# Altium project Master-Board-v2.0.PrjPcb (part 6 of 11)

## Sheet Display-Sheet.SchDoc
size 420 x 297 mm; SheetNumber: 5; SheetTotal: 15
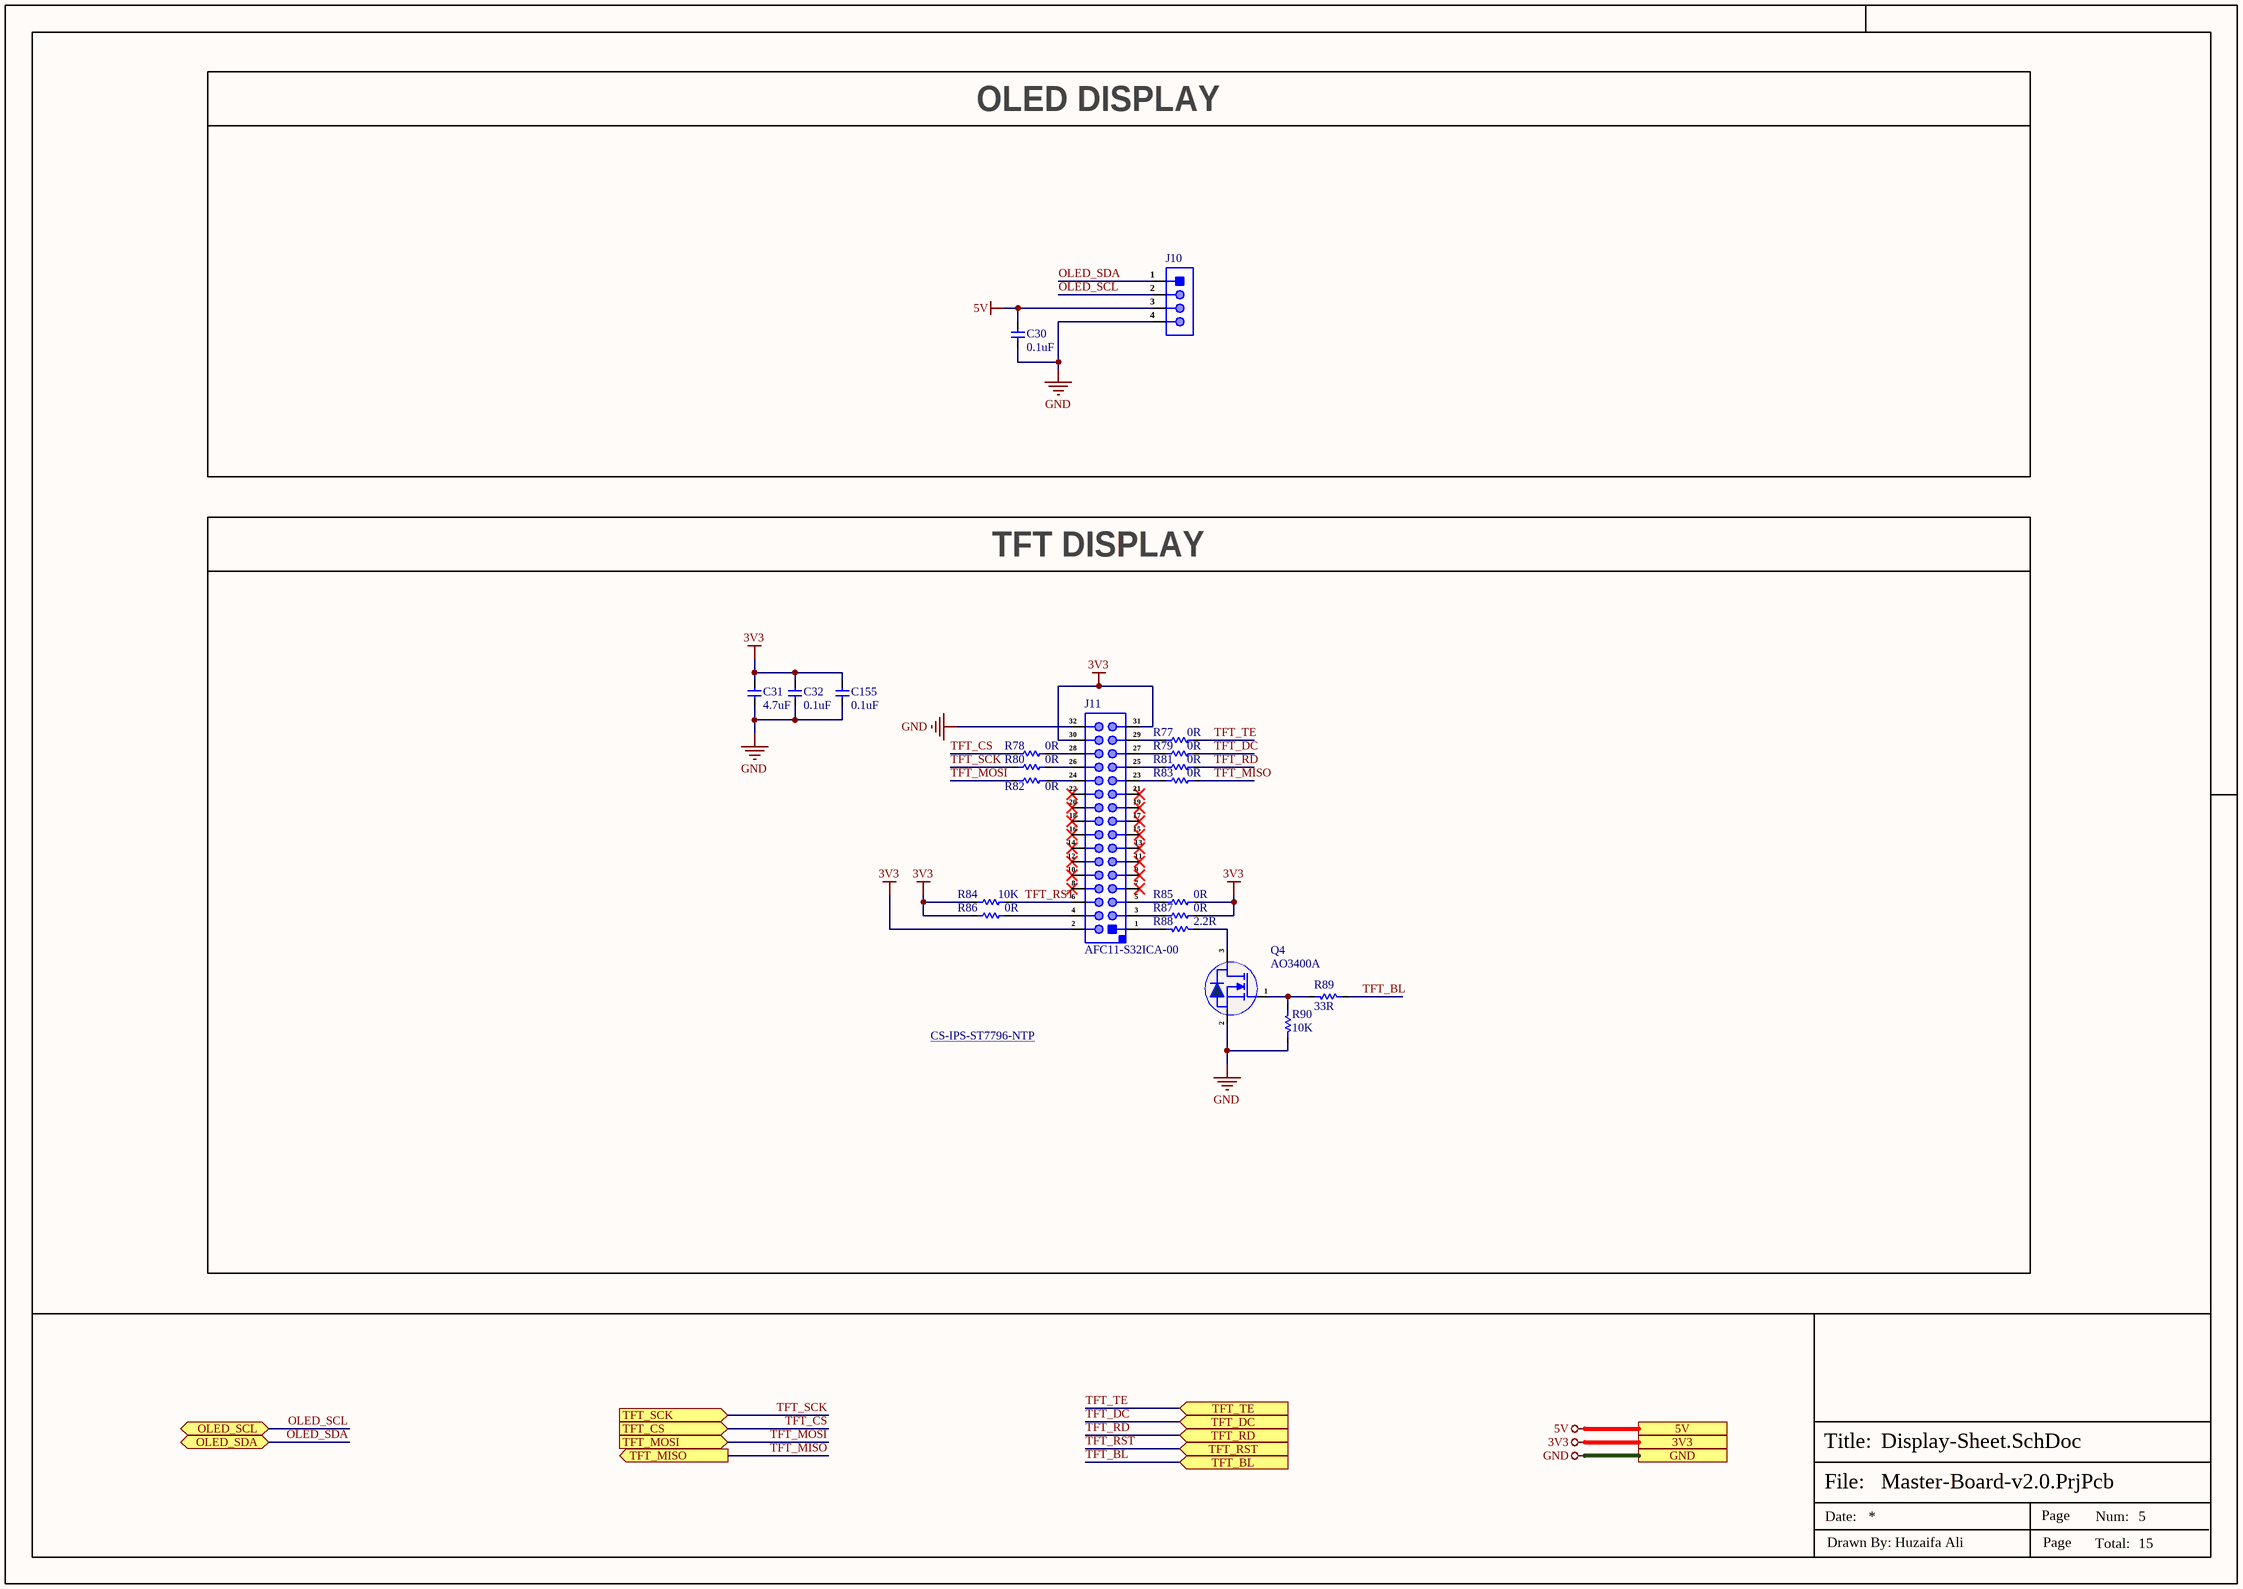
[diagram p4: Display-Sheet.SchDoc]

### Parts
C30  0.1uF  [Cap-0402]
C31  4.7uF  [Cap-0402]
C32  0.1uF  [Cap-0402]
C155  0.1uF  [Cap-0402]
J10  B4B-XH-A(LF)(SN)  [B4B-XH-A(LF)(SN).]  (value not drawn)
J11  AFC11-S32ICA-00  [AFC11-S32ICA-00]
Q4  AO3400A  [sot-23]
R77  0R  [Res-0402]
R78  0R  [Res-0402]
R79  0R  [Res-0402]
R80  0R  [Res-0402]
R81  0R  [Res-0402]
R82  0R  [Res-0402]
R83  0R  [Res-0402]
R84  10K  [Res-0402]
R85  0R  [Res-0402]
R86  0R  [Res-0402]
R87  0R  [Res-0402]
R88  2.2R  [Res-0603]
R89  33R  [Res-0402]
R90  10K  [Res-0402]

### Blocks framed on the sheet
OLED DISPLAY: C30 J10
TFT DISPLAY: C31 C32 C155 J11 Q4 R77-R90

### Ports
3V3 (see Top-Sheet[2B], CAN-Sheet[5D], Controller-Sheet-1[4D], Controller-Sheet-2[4D], Controller-Sheet-3[4D], DIOs-Lights-Sensors-Sheet[4D], ESP32_Sheet[6D], EtherCAT-Sheet[1D], Ethernet-Sheet[5D], Power-Sheet[4D], RS232-Sheet[5D], RS485-Sheet[5D], STM32-USB-Sheet[4D]), 5V (see Top-Sheet[2B], Analog-AIO-Sheet[5D], CAN-Sheet[5D], Controller-Sheet-2[4D], Controller-Sheet-3[4D], DIOs-Lights-Sensors-Sheet[4D], Power-Sheet[4D], RS232-Sheet[5D], RS485-Sheet[5D], STM32-USB-Sheet[4D]), GND (see Top-Sheet[2B], Analog-AIO-Sheet[5D], CAN-Sheet[6D], Controller-Sheet-1[4D], Controller-Sheet-2[4D], Controller-Sheet-3[4D], DIOs-Lights-Sensors-Sheet[4D], ESP32_Sheet[6D], EtherCAT-Sheet[1D], Ethernet-Sheet[5D], Power-Sheet[4D], RS232-Sheet[5D], RS485-Sheet[5D], STM32-USB-Sheet[4D]), OLED_SCL (bidir, see Top-Sheet[2C]), OLED_SDA (bidir, see Top-Sheet[2C]), TFT_BL (in, see Top-Sheet[2C]), TFT_CS (in, see Top-Sheet[2B]), TFT_DC (in, see Top-Sheet[2C]), TFT_MISO (out, see Top-Sheet[2C]), TFT_MOSI (in, see Top-Sheet[2B]), TFT_RD (in, see Top-Sheet[2C]), TFT_RST (in, see Top-Sheet[2C]), TFT_SCK (in, see Top-Sheet[2B]), TFT_TE (in, see Top-Sheet[2C])

### Nets
3V3: C31.2 C32.2 C155.2 J11.2 J11.30 J11.31 R84.2 R85.1 R86.1 R87.2 ; port 3V3
5V: C30.1 J10.3 ; port 5V
GND: C30.2 C31.1 C32.1 C155.1 J10.4 J11.32 Q4.2(S) R90.2 ; port GND
OLED_SCL: J10.2 ; port OLED_SCL  [project net 5V-ESP-SCL]
OLED_SDA: J10.1 ; port OLED_SDA  [project net 5V-ESP-SDA]
TFT_BL: R89.1 ; port TFT_BL  [project net DO_PE8]
TFT_CS: R78.1 ; port TFT_CS  [project net SPI4_NSS]
TFT_DC: R79.1 ; port TFT_DC  [project net DO_PE10]
TFT_MISO: R83.1 ; port TFT_MISO  [project net SPI4_MISO]
TFT_MOSI: R82.1 ; port TFT_MOSI  [project net SPI4_MOSI]
TFT_RD: R81.1 ; port TFT_RD  [project net DO_PE11]
TFT_RST: J11.6 R84.1 ; port TFT_RST  [project net DO_PE7]
TFT_SCK: R80.1 ; port TFT_SCK  [project net SPI4_SCK]
TFT_TE: R77.1 ; port TFT_TE  [project net DO_PE9]
NetJ11_1: J11.1 R88.2
NetJ11_3: J11.3 R87.1
NetJ11_4: J11.4 R86.2
NetJ11_5: J11.5 R85.2
NetJ11_23: J11.23 R83.2
NetJ11_24: J11.24 R82.2
NetJ11_25: J11.25 R81.2
NetJ11_26: J11.26 R80.2
NetJ11_27: J11.27 R79.2
NetJ11_28: J11.28 R78.2
NetJ11_29: J11.29 R77.2
NetQ4_1: Q4.1(G) R89.2 R90.1
NetQ4_3: Q4.3(D) R88.1

Not connected (* = marked no-connect by the designer): J11 7* 8* 9* 10* 11* 12* 13* 14* 15* 16* 17* 18* 19* 20* 21* 22*

### Notes on the sheet
- CS-IPS-ST7796-NTP <https://vi.aliexpress.com/item/1005004799040521.html>
- File:
- Title:
- Date:
- Page
- Num:
- Total:
- Drawn By: Huzaifa Ali

### Library data of the parts
C30 C32 C155 = CC0402JRX7R7BB104: CAP CER 0.1UF 16V X7R 0402; Manufacturer: Yageo; Material: 4241ConductorMaterial; Value: 100nF; Tolerance: 5%; Item Type: Capacitor; Supplier: Digikey; Supplier Part Number: 311-1676-1-ND; Manufacturer Part Number: CC0402JRX7R7BB104; RoHS: Yes; Category: Ceramic Capacitors; Stock: 1659111; Pricing: 1=0.1, 10=0.046, 50=0.0262, 100=0.0203, 500=0.01528, 1000=0.012, 2500=0.01091, 5000=0.01004 (USD); Mounting Technology: Surface Mount; Case/Package: 0402; Case Code (Metric): 1005; Case Code (Imperial): 0402; Min Operating Temperature: -55°C; Max Operating Temperature: 125°C; Dielectric: X7R; Packaging: Tape and Reel; Package Quantity: 10000; Voltage Rating (DC): 16V; Voltage Rating: 16V; Series: CC; Construction: Flat; Length: 0.039inch; Width: 0.02inch; Height: 0.5mm; Thickness: 0.022inch; Lead Free: Lead Free; Halogen Free: Halogen Free; RoHS Compliant: Yes; ComponentLink1URL: https://datasheet.ciiva.com/13210/upy-gphc-x7r-6-3v-to-50v-8-12304-13210152.pdf?src-supplier=Mouser; ComponentLink1Description: https://datasheet.ciiva.com/13210/upy-gphc-x7r-6-3v-to-50v-8-12304-13210152.pdf?src-supplier=Mouser; LCSC Part Number: C541464
C31 = CC0402KRX5R6BB475: CAP CER 4.7UF 10V X5R 0402; Manufacturer: Yageo; Tolerance: 10%; Supplier 1: Farnell; Manufacturer Part Number: CC0402KRX5R6BB475; RoHS: Yes; Category: Ceramic Capacitors; Stock 1: 20000; Pricing 1: 10000=0.02310, 50000=0.02100 (GBP); Mount: Surface Mount; Case/Package: 0402; Case Code (Imperial): 0402; Case Code (Metric): 1005; Min Operating Temperature: -55°C; Max Operating Temperature: 85°C; Packaging: Cut Tape; Capacitance: 4.7uF; Voltage Rating: 10V; RoHS Compliant: Yes; ComponentLink1URL: http://www.yageo.com/documents/recent/UPY-GPHC_X5R_4V-to-50V_25.pdf?src-supplier=Digi-Key; ComponentLink1Description: http://www.yageo.com/documents/recent/UPY-GPHC_X5R_4V-to-50V_25.pdf?src-supplier=Digi-Key; Supplier Part Number 1: 3871698; LCSC Part Number: C326586
J10 = B4B-XH-A(LF)(SN): CONN HEADER VERT 4POS 2.5MM; Manufacturer: JST; Current Rating: 3A; Gender: Male; Contact Resistance: 20mR; Voltage Rating (AC): 250V; Connector Type: Male Pin; Number of Positions: 4; Insulation Resistance: 1GR; Wire/Cable Gauge: 22AWG; Item Type: JST Connector; Supplier 1: Future Electronics; Manufacturer Part Number: B4B-XH-A(LF)(SN); RoHS: Yes; Category: FFC / FPC; Pricing 1: 1=0.13000, 300=0.11300, 1000=0.11000, 3000=0.10700, 10000=0.10400 (USD); Mount: Through Hole; Contact Material: Brass; Material: Polyamide; Contact Plating: Tin,Copper,Lead; Color: Natural; Housing Material: Polyamide; Housing Color: White; Min Operating Temperature: -25°C; Max Operating Temperature: 85°C; Number of Rows: 1; Max Current Rating: 3A; Package Quantity: 500; Packaging: Bulk; Voltage Rating: 250V; Termination: Press-Fit; Max Voltage Rating (AC): 250V; Max Voltage Rating (DC): 250V; Number of Contacts: 4; Orientation: Straight; Length: 12.4mm; Pitch: 2.5mm; Lead Pitch: 2.5mm; Depth: 5.75mm; REACH SVHC: No SVHC; Lead Free: Lead Free; ComponentLink1URL: https://datasheet.ciiva.com/26894/getdatasheetpartid-455616-26894787.pdf?src-supplier=Verical; ComponentLink1Description: https://datasheet.ciiva.com/26894/getdatasheetpartid-455616-26894787.pdf?src-supplier=Verical; ComponentLink2URL: https://datasheet.ciiva.com/26924/getdatasheetpartid-640571-26924035.pdf?src-supplier=Verical; ComponentLink2Description: https://datasheet.ciiva.com/26924/getdatasheetpartid-640571-26924035.pdf?src-supplier=Verical; ComponentLink3URL: https://datasheet.ciiva.com/16203/b4b-xh-alfsn-16203642.pdf?src-supplier=Future+Electronics; ComponentLink3Description: https://datasheet.ciiva.com/16203/b4b-xh-alfsn-16203642.pdf?src-supplier=Future+Electronics; ComponentLink4URL: https://datasheet.ciiva.com/726/exh-726404.pdf?src-supplier=Digi-Key; ComponentLink4Description: https://datasheet.ciiva.com/726/exh-726404.pdf?src-supplier=Digi-Key; Supplier Part Number 1: 8134090; LCSC Part Number: C144395
J11 = AFC11-S32ICA-00: Drawer Type 32P Single-sided contact points/Vertical Standing paste 0.5mm SMD,P=0.5mm FFC, FPC (Flat Flexible) Connector Assemblies ROHS; Manufacturer: JUSHUO; Item Type: FFC , FPC Connector; Manufacturer Part Number: AFC11-S32ICA-00; Package: SMD,P=0.5mm; LCSC Part Number: C262506; ComponentLink1Description: LCSC; ComponentLink1URL: https://www.lcsc.com/product-detail/FFC-FPC-Flat-Flexible-Connector-Assemblies_JUSHUO-AFC11-S32ICA-00_C262506.html?s_z=n_AFC11-S32ICA-00
Q4 = AO3400A: 30V 5.8A 32mΩ@10V,5.8A 1.4W 1.4V@250uA N Channel SOT-23 MOSFETs ROHS; Manufacturer: BORN; Item Type: Mosfet; ComponentLink1Description: LCSC; ComponentLink1URL: https://www.lcsc.com/product-detail/MOSFETs_BORN-AO3400A_C344010.html; Manufacturer Part Number: AO3400A; Footprint: SOT-23; LCSC Part Number: C344010
R77-R83 R85-R87 = RC0402FR-070RL: RES 0 OHM JUMPER 1/16W 0402; Manufacturer: Yageo; Item Type: Resistors; Tolerance: 1%; Power Rating: 62.5mW; Voltage Rating: 50V; Temperature Coefficient: 200ppm/°C; Max Power Dissipation: 63mW; Supplier 1: Mouser; Manufacturer Part Number: RC0402FR-070RL; RoHS: Yes; Stock 1: 8556842; Pricing 1: 1=0.10000, 10=0.01400, 50=0.01400, 100=0.00600, 1000=0.00300, 5000=0.00200, 10000=0.00100 (USD); Mount: Surface Mount; Case/Package: 0402; Contact Plating: Tin,Matte; Case Code (Imperial): 0402; Case Code (Metric): 1005; Size Code: 0402; Min Operating Temperature: -55°C; Max Operating Temperature: 155°C; Resistance: 0R; Resistor Type: Thick Film; Packaging: Tape and Reel; Termination: SMD/SMT; Features: Moisture Resistant; Series: RC; Number of Terminations: 2; Length: 1mm; Width: 0.5mm; Height: 0.35mm; Radiation Hardening: No; Lead Free: Lead Free; RoHS Compliant: Yes; ComponentLink1URL: https://datasheet.ciiva.com/8896/pyu-rc0402-51-rohs-l-6-8896149.pdf?src-supplier=Avnet; ComponentLink1Description: https://datasheet.ciiva.com/8896/pyu-rc0402-51-rohs-l-6-8896149.pdf?src-supplier=Avnet; ComponentLink2URL: https://datasheet.ciiva.com/16790/pyu-rc0402-51-rohs-l-6-r-16790444.pdf?src-supplier=Future+Electronics; ComponentLink2Description: https://datasheet.ciiva.com/16790/pyu-rc0402-51-rohs-l-6-r-16790444.pdf?src-supplier=Future+Electronics; Supplier Part Number 1: 603-RC0402FR-070RL; LCSC Part Number: C106231
R84 R90 = RC0402FR-0710KL: RES 10K OHM 1% 1/16W 0402; Manufacturer: Yageo; Resistance: 10kR; Voltage Rating (DC): 50V; Temperature Coefficient: 100ppm/°C; Power Rating: 62.5mW; Max Power Dissipation: 63mW; Item Type: Resistor; Supplier 1: Mouser; Manufacturer Part Number: RC0402FR-0710KL; RoHS: Yes; Category: Chip SMD Resistors; Stock 1: 18648329; Pricing 1: 1=0.10000, 10=0.01400, 50=0.01400, 100=0.00500, 1000=0.00300, 10000=0.00200 (USD); Case/Package: 0402; Number of Pins: 2; Case Code (Imperial): 0402; Case Code (Metric): 1005; Min Operating Temperature: -55°C; Max Operating Temperature: 155°C; Resistor Type: Thick Film; Tolerance: 1%; Packaging: Tape and Reel; Voltage Rating: 50V; Termination: SMD/SMT; Working Voltage: 50V; Number of Terminations: 2; Features: Moisture Resistant; Series: RC; Resistance Tolerance: 1%; Construction: Rectangular; Length: 1mm; Width: 0.5mm; Height: 0.32mm; Depth: 0.5mm; Lead Pitch: 0.2mm; REACH SVHC: No SVHC; Lead Free: Lead Free; RoHS Compliant: Yes; Military Standard: Not; ComponentLink1URL: https://datasheet.ciiva.com/7660/38568-7660787.pdf?src-supplier=Element14; ComponentLink1Description: https://datasheet.ciiva.com/7660/38568-7660787.pdf?src-supplier=Element14; ComponentLink2URL: https://datasheet.ciiva.com/7849/1686128-7849814.pdf?src-supplier=Element14; ComponentLink2Description: https://datasheet.ciiva.com/7849/1686128-7849814.pdf?src-supplier=Element14; ComponentLink3URL: https://datasheet.ciiva.com/7983/1018594-7983486.pdf?src-supplier=Element14; ComponentLink3Description: https://datasheet.ciiva.com/7983/1018594-7983486.pdf?src-supplier=Element14; ComponentLink4URL: https://datasheet.ciiva.com/22747/1018594-22747512.pdf?src-supplier=Element14; ComponentLink4Description: https://datasheet.ciiva.com/22747/1018594-22747512.pdf?src-supplier=Element14; ComponentLink5URL: https://datasheet.ciiva.com/12667/pyu-rc0402-51-rohs-l-6-r-12667067.pdf?src-supplier=Mouser; ComponentLink5Description: https://datasheet.ciiva.com/12667/pyu-rc0402-51-rohs-l-6-r-12667067.pdf?src-supplier=Mouser; ComponentLink6URL: https://datasheet.ciiva.com/7849/1784430-7849813.pdf?src-supplier=Element14; ComponentLink6Description: https://datasheet.ciiva.com/7849/1784430-7849813.pdf?src-supplier=Element14; ComponentLink7URL: https://datasheet.ciiva.com/7849/1784430-7849815.pdf?src-supplier=Element14; ComponentLink7Description: https://datasheet.ciiva.com/7849/1784430-7849815.pdf?src-supplier=Element14; Supplier Part Number 1: 603-RC0402FR-0710KL; LCSC Part Number: C60490
R88 = RC0603FR-072R2L: RES 2.2 OHM 1% 1/10W 0603; Manufacturer: Yageo; Item Type: Resistors; Voltage Rating: 50V; Power Rating: 100mW; Temperature Coefficient: 200ppm/°C; Supplier: Digikey; LCSC Part Number: C112307; Manufacturer Part Number: RC0603FR-072R2L; RoHS: Yes; Stock: 331140; Pricing: 1=0.1, 10=0.029, 50=0.0188, 100=0.0158, 500=0.01094, 1000=0.00947 (USD); Case/Package: 0603; Pins: 2; Case Code (Metric): 1608; Case Code (Imperial): 0603; Min Operating Temperature: -55°C; Max Operating Temperature: 155°C; Voltage Rating (DC): 50V; Package Quantity: 1; Value: 2.2R; Tolerance: 1%; Packaging: Tape and Reel; Resistor Type: Thick Film; Number of Terminations: 2; Termination: SMD/SMT; Max Power Dissipation: 100mW; Features: Moisture Resistant; Series: RC; Technology: THICK FILM; Resistance Tolerance: 1%; Length: 0.063inch; Width: 0.031inch; Height: 0.022inch; Depth: 0.8mm; Reach SVHC Compliant: No; Lead Free: Lead Free; RoHS Compliant: Yes; ComponentLink1URL: https://datasheet.ciiva.com/11808/0900766b80f96399-11808160.pdf?src-supplier=Rs; ComponentLink1Description: https://datasheet.ciiva.com/11808/0900766b80f96399-11808160.pdf?src-supplier=Rs; ComponentLink2URL: https://datasheet.ciiva.com/2554/pyu-r-int-thick-7-2554421.pdf?src-supplier=Digikey; ComponentLink2Description: https://datasheet.ciiva.com/2554/pyu-r-int-thick-7-2554421.pdf?src-supplier=Digikey; ComponentLink3URL: https://datasheet.ciiva.com/2554/pyu-r-int-thick-7-2554422.pdf?src-supplier=Digikey; ComponentLink3Description: https://datasheet.ciiva.com/2554/pyu-r-int-thick-7-2554422.pdf?src-supplier=Digikey; ComponentLink4URL: https://datasheet.ciiva.com/2554/pyu-r-int-thick-7-2554420.pdf?src-supplier=Digikey; ComponentLink4Description: https://datasheet.ciiva.com/2554/pyu-r-int-thick-7-2554420.pdf?src-supplier=Digikey
R89 = RC0402FR-0733RL: RES 33 OHM 1% 1/16W 0402; Manufacturer: Yageo; Power Rating: 62.5mW; Voltage Rating: 50V; Temperature Coefficient: 100ppm/°C; Max Power Dissipation: 63mW; Supplier 1: Mouser; Manufacturer Part Number: RC0402FR-0733RL; RoHS: Yes; Category: Chip SMD Resistors; Stock 1: 1843488; Pricing 1: 1=0.10000, 10=0.01200, 50=0.01200, 100=0.00500, 1000=0.00300, 10000=0.00100 (USD); Case/Package: 0402; Number of Pins: 2; Case Code (Imperial): 0402; Case Code (Metric): 1005; Size Code: 0402; Min Operating Temperature: -55°C; Max Operating Temperature: 155°C; Resistor Type: Thick Film; Resistance: 33R; Tolerance: 1%; Packaging: Tape and Reel; Voltage Rating (DC): 50V; Package Quantity: 10000; Termination: SMD/SMT; Features: Moisture Resistant; Series: RC; Number of Terminations: 2; Resistance Tolerance: 1%; Construction: Rectangular; Technology: THICK FILM; Length: 1mm; Width: 0.5mm; Height: 0.35mm; Depth: 0.5mm; RoHS Compliant: Yes; REACH SVHC: Unknown; Military Standard: Not; Lead Free: Lead Free; ComponentLink1URL: https://datasheet.ciiva.com/11819/0900766b80c66297-11819487.pdf?src-supplier=RSComponents; ComponentLink1Description: https://datasheet.ciiva.com/11819/0900766b80c66297-11819487.pdf?src-supplier=RSComponents; ComponentLink2URL: https://datasheet.ciiva.com/24070/pyu-rc0402-51-rohs-l-6-r-8721-24070077.pdf?src-supplier=Mouser; ComponentLink2Description: https://datasheet.ciiva.com/24070/pyu-rc0402-51-rohs-l-6-r-8721-24070077.pdf?src-supplier=Mouser; ComponentLink3URL: https://datasheet.ciiva.com/7849/1018594-7849967.pdf?src-supplier=Element14; ComponentLink3Description: https://datasheet.ciiva.com/7849/1018594-7849967.pdf?src-supplier=Element14; ComponentLink4URL: https://datasheet.ciiva.com/7849/1018594-7849966.pdf?src-supplier=Element14; ComponentLink4Description: https://datasheet.ciiva.com/7849/1018594-7849966.pdf?src-supplier=Element14; ComponentLink5URL: https://datasheet.ciiva.com/15189/getdatasheetpartid-329253-15189431.pdf?src-supplier=Verical; ComponentLink5Description: https://datasheet.ciiva.com/15189/getdatasheetpartid-329253-15189431.pdf?src-supplier=Verical; ComponentLink6URL: https://datasheet.ciiva.com/17070/pyu-rc0402-51-rohs-l-6-r-17070335.pdf?src-supplier=Future+Electronics; ComponentLink6Description: https://datasheet.ciiva.com/17070/pyu-rc0402-51-rohs-l-6-r-17070335.pdf?src-supplier=Future+Electronics; Supplier Part Number 1: 603-RC0402FR-0733RL; LCSC Part Number: C138002

## Sheet Controller-Sheet-2.SchDoc
size 420 x 297 mm; SheetNumber: 7; SheetTotal: 15
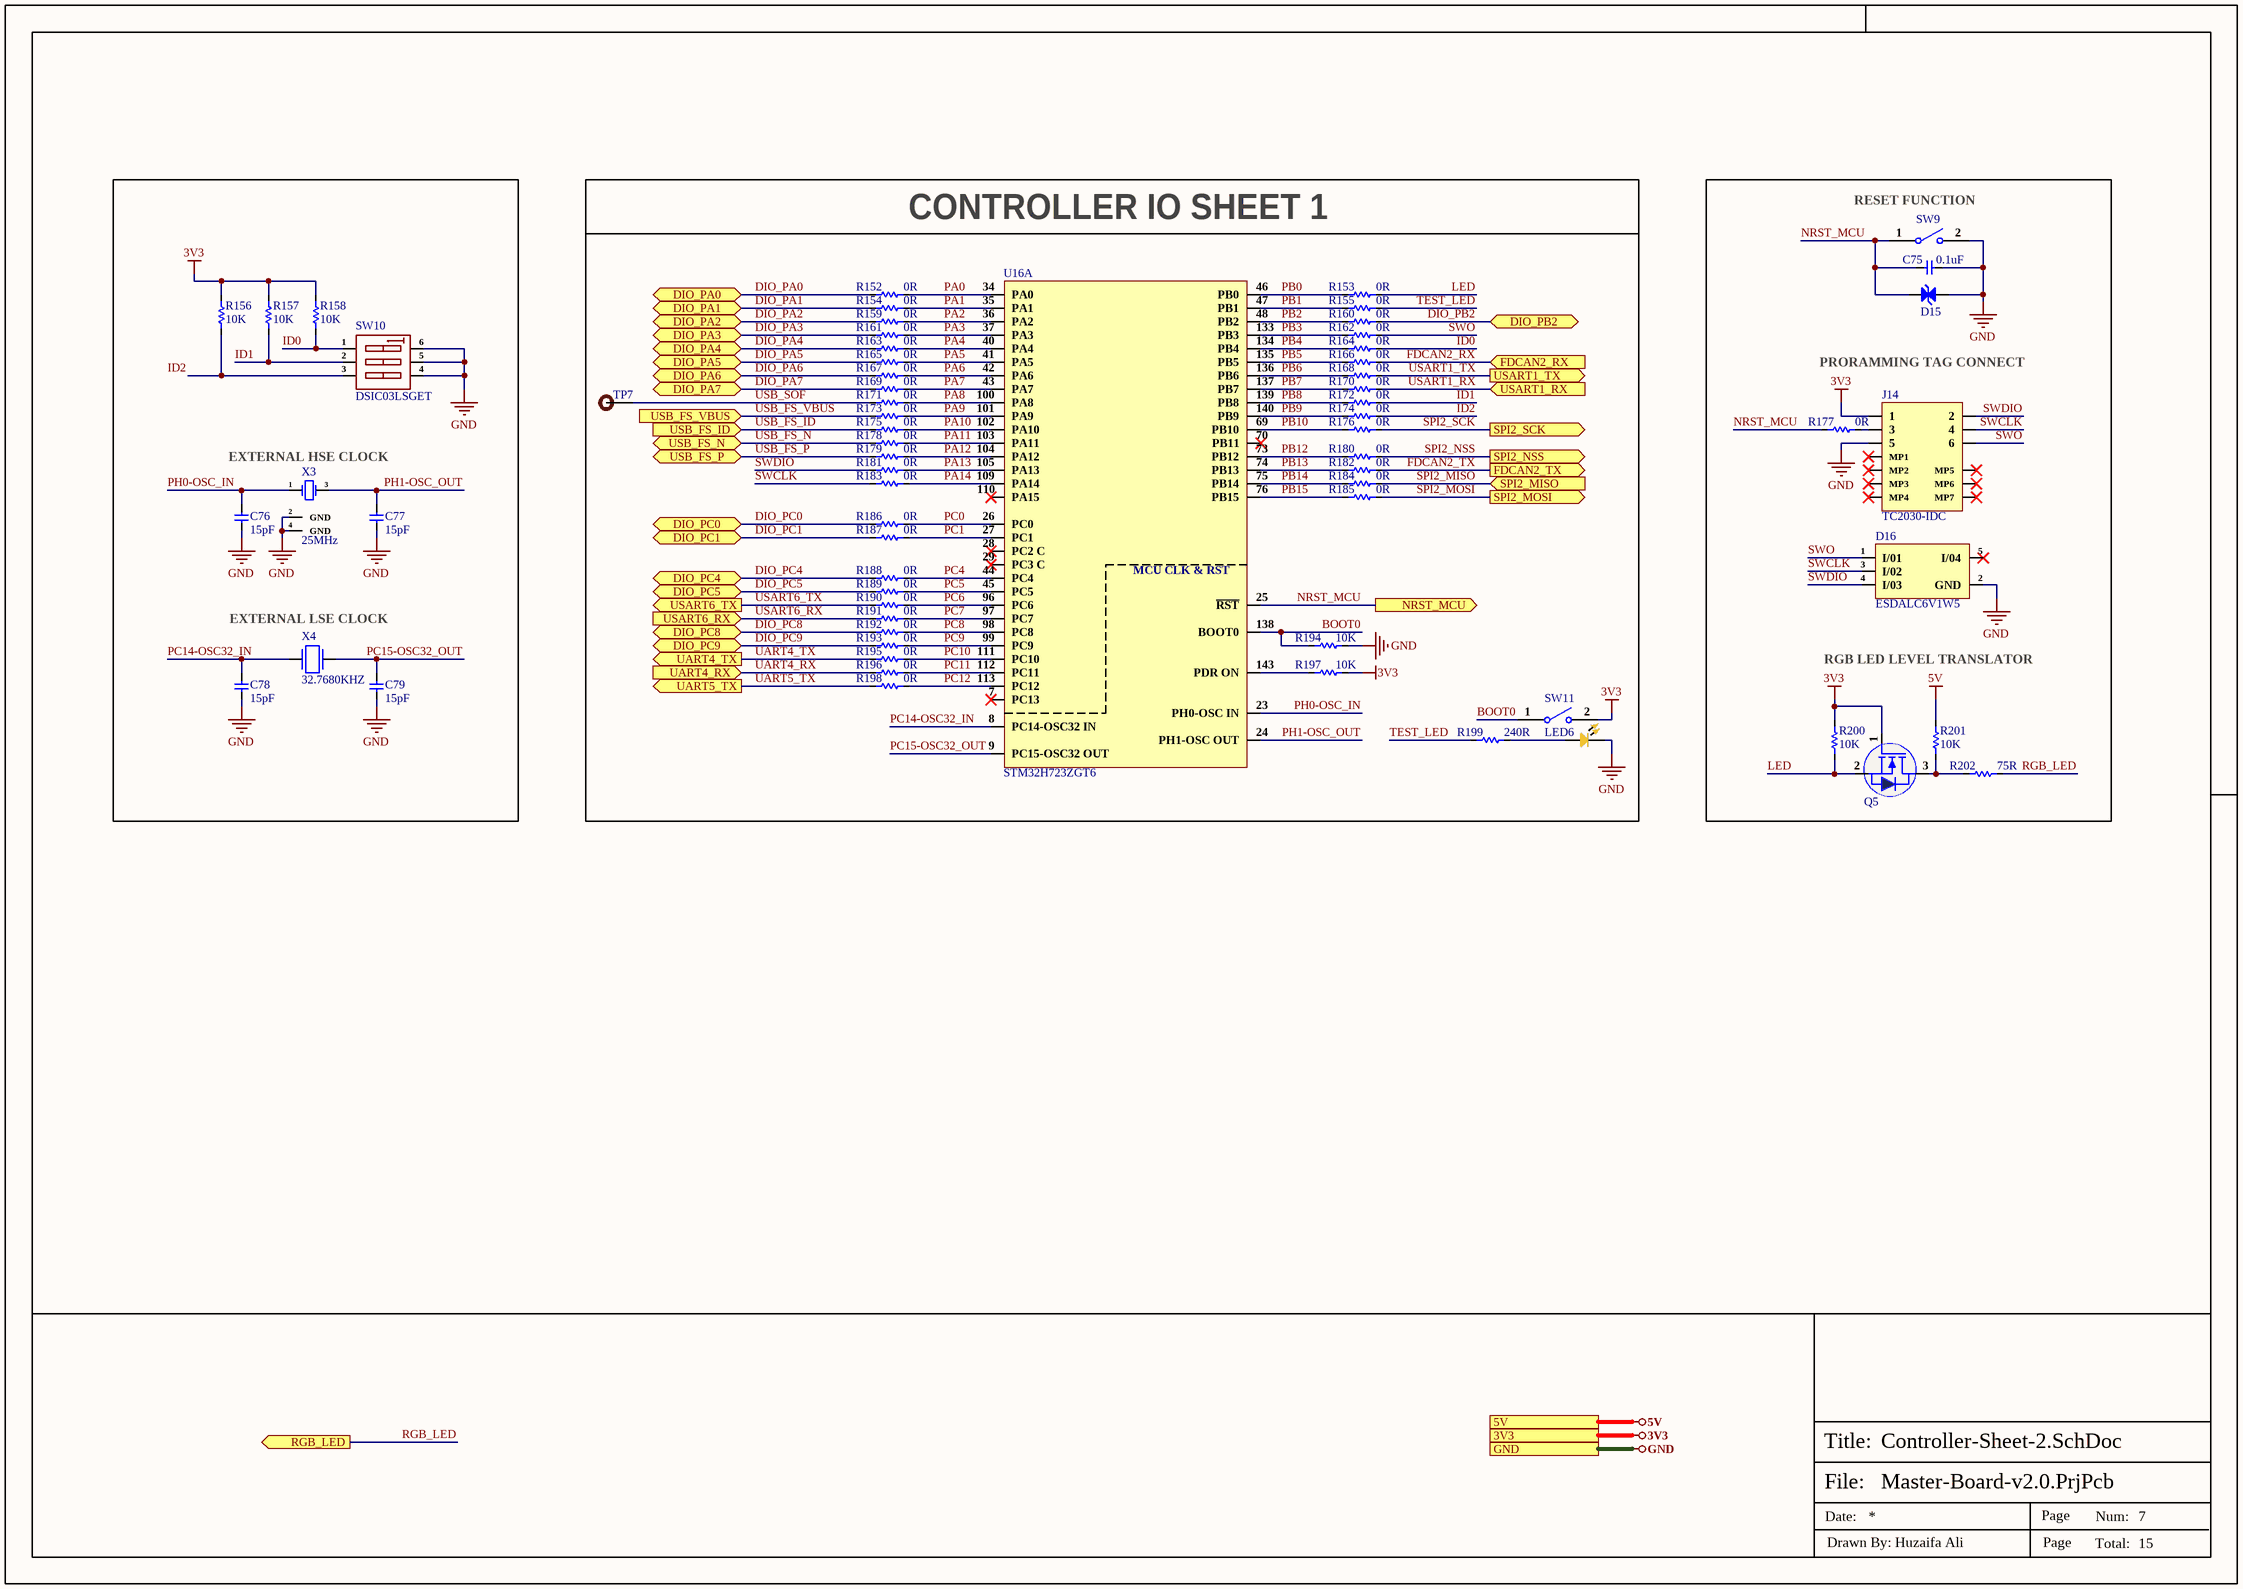
[diagram p5: Controller-Sheet-2.SchDoc]

### Parts
C75  0.1uF  [Cap-0402]
C76  15pF  [Cap-0201]
C77  15pF  [Cap-0201]
C78  15pF  [Cap-0201]
C79  15pF  [Cap-0201]
D15  ESDM2033MX4T5G  [DFN-2(0.3x0.6)]  (value not drawn)
D16  ESDALC6V1W5  [SOT-323-5]
J14  TC2030-IDC  [TC2030-IDC_]
LED6  Yellow  [LED-0603]  (value not drawn)
Q5  Si2302CDS  [Sot-23]  (value not drawn)
R152  0R  [Res-0402]
R153  0R  [Res-0402]
R154  0R  [Res-0402]
R155  0R  [Res-0402]
R156  10K  [Res-0402]
R157  10K  [Res-0402]
R158  10K  [Res-0402]
R159  0R  [Res-0402]
R160  0R  [Res-0402]
R161  0R  [Res-0402]
R162  0R  [Res-0402]
R163  0R  [Res-0402]
R164  0R  [Res-0402]
R165  0R  [Res-0402]
R166  0R  [Res-0402]
R167  0R  [Res-0402]
R168  0R  [Res-0402]
R169  0R  [Res-0402]
R170  0R  [Res-0402]
R171  0R  [Res-0402]
R172  0R  [Res-0402]
R173  0R  [Res-0402]
R174  0R  [Res-0402]
R175  0R  [Res-0402]
R176  0R  [Res-0402]
R177  0R  [Res-0402]
R178  0R  [Res-0402]
R179  0R  [Res-0402]
R180  0R  [Res-0402]
R181  0R  [Res-0402]
R182  0R  [Res-0402]
R183  0R  [Res-0402]
R184  0R  [Res-0402]
R185  0R  [Res-0402]
R186  0R  [Res-0402]
R187  0R  [Res-0402]
R188  0R  [Res-0402]
R189  0R  [Res-0402]
R190  0R  [Res-0402]
R191  0R  [Res-0402]
R192  0R  [Res-0402]
R193  0R  [Res-0402]
R194  10K  [Res-0402]
R195  0R  [Res-0402]
R196  0R  [Res-0402]
R197  10K  [Res-0402]
R198  0R  [Res-0402]
R199  240R  [Res-0402]
R200  10K  [Res-0402]
R201  10K  [Res-0402]
R202  75R  [Res-0402]
SW9  B3U-1000P  [B3U-1000P]  (value not drawn)
SW10  DSIC03LSGET  [DSIC03LSGET]
SW11  B3U-1000P  [B3U-1000P]  (value not drawn)
TP7  TEST POINT 0.5mm Dia  [Test-point - 0.5mm]  (value not drawn)  (no BOM)
U16  STM32H723ZGT6  [LQFP-144(20x20)]  (part A of 3)
X3  25MHz  [Q22FA12800090]
X4  32.7680KHZ  [NX3215SA-32.768K-STD-MUA-8_]

### Blocks framed on the sheet
CONTROLLER IO SHEET 1: LED6 R152-R155 R159-R176 R178-R199 SW11 TP7 U16

### Ports
3V3 (see Top-Sheet[3A], CAN-Sheet[5D], Controller-Sheet-1[4D], DIOs-Lights-Sensors-Sheet[4D], Display-Sheet[5D], ESP32_Sheet[6D], EtherCAT-Sheet[1D], Ethernet-Sheet[5D], Power-Sheet[4D], RS232-Sheet[5D], RS485-Sheet[5D], STM32-USB-Sheet[4D]), 5V (see Top-Sheet[3A], Analog-AIO-Sheet[5D], CAN-Sheet[5D], DIOs-Lights-Sensors-Sheet[4D], Display-Sheet[5D], Power-Sheet[4D], RS232-Sheet[5D], RS485-Sheet[5D], STM32-USB-Sheet[4D]), DIO_PA0 (bidir, see Top-Sheet[4A]), DIO_PA1 (bidir, see Top-Sheet[4A]), DIO_PA2 (bidir, see Top-Sheet[4A]), DIO_PA3 (bidir, see Top-Sheet[4A]), DIO_PA4 (bidir, see Top-Sheet[3A]), DIO_PA5 (bidir, see Top-Sheet[3A]), DIO_PA6 (bidir, see Top-Sheet[4A]), DIO_PA7 (bidir, see Top-Sheet[4B]), DIO_PB2 (bidir, see Top-Sheet[3B]), DIO_PC0 (bidir, see Top-Sheet[4B]), DIO_PC1 (bidir, see Top-Sheet[4B]), DIO_PC4 (bidir, see Top-Sheet[4B]), DIO_PC5 (bidir, see Top-Sheet[4B]), DIO_PC8 (bidir, see Top-Sheet[4B]), DIO_PC9 (bidir, see Top-Sheet[4B]), FDCAN2_RX (in, see Top-Sheet[3B]), FDCAN2_TX (out, see Top-Sheet[3B]), GND (see Top-Sheet[3A], Analog-AIO-Sheet[5D], CAN-Sheet[6D], Controller-Sheet-1[4D], Controller-Sheet-3[4D], DIOs-Lights-Sensors-Sheet[4D], Display-Sheet[5D], ESP32_Sheet[6D], EtherCAT-Sheet[1D], Ethernet-Sheet[5D], Power-Sheet[4D], RS232-Sheet[5D], RS485-Sheet[5D], STM32-USB-Sheet[4D]), NRST_MCU (out, see Top-Sheet[3B]), RGB_LED (out, see Top-Sheet[3B]), SPI2_MISO (in, see Top-Sheet[3A]), SPI2_MOSI (out, see Top-Sheet[3A]), SPI2_NSS (out, see Top-Sheet[3A]), SPI2_SCK (out, see Top-Sheet[3A]), UART4_RX (in, see Top-Sheet[4A]), UART4_TX (out, see Top-Sheet[4A]), UART5_TX (out, see Top-Sheet[3A]), USART1_RX (in, see Top-Sheet[4B]), USART1_TX (out, see Top-Sheet[4B]), USART6_RX (in, see Top-Sheet[3A]), USART6_TX (out, see Top-Sheet[3A]), USB_FS_ID (in, see Top-Sheet[4A], STM32-USB-Sheet[1D]), USB_FS_N (bidir, see Top-Sheet[4A], STM32-USB-Sheet[1D]), USB_FS_P (bidir, see Top-Sheet[4A], STM32-USB-Sheet[1D]), USB_FS_VBUS (in, see Top-Sheet[4A], STM32-USB-Sheet[1D])

### Nets
3V3: J14.1 Q5.1(G) R156.2 R157.2 R158.2 R197.1 R200.2 SW11.2 ; port 3V3
5V: R201.2 ; port 5V
GND: C75.1 C76.1 C77.1 C78.1 C79.1 D15.1(A) D16.2(GND) J14.5 LED6.2 R194.1 SW9.2 SW10.4(B3) SW10.5(B2) SW10.6(B1) X3.2(GND) X3.4(GND) ; port GND
BOOT0: R194.2 SW11.1 U16.138(BOOT0)
DIO_PA0: R152.2 ; port DIO_PA0
DIO_PA1: R154.2 ; port DIO_PA1
DIO_PA2: R159.2 ; port DIO_PA2
DIO_PA3: R161.2 ; port DIO_PA3
DIO_PA4: R163.2 ; port DIO_PA4
DIO_PA5: R165.2 ; port DIO_PA5
DIO_PA6: R167.2 ; port DIO_PA6
DIO_PA7: R169.2 ; port DIO_PA7
DIO_PB2: R160.1 ; port DIO_PB2
DIO_PC0: R186.2 ; port DIO_PC0
DIO_PC1: R187.2 ; port DIO_PC1
DIO_PC4: R188.2 ; port DIO_PC4
DIO_PC5: R189.2 ; port DIO_PC5
DIO_PC8: R192.2 ; port DIO_PC8
DIO_PC9: R193.2 ; port DIO_PC9
FDCAN2_RX: R166.1 ; port FDCAN2_RX  [project net CAN2_RXD]
FDCAN2_TX: R182.1 ; port FDCAN2_TX  [project net CAN2_TXD]
ID0: R158.1 R164.1 SW10.1(A1)
ID1: R157.1 R172.1 SW10.2(A2)
ID2: R156.1 R174.1 SW10.3(A3)
LED: Q5.2(S) R153.1 R200.1
NRST_MCU: C75.2 D15.2(A) R177.2 SW9.1 U16.25(~{RST}) ; port NRST_MCU  [project net ESP_EXP_IO6]
PA0: R152.1 U16.34(PA0)
PA1: R154.1 U16.35(PA1)
PA2: R159.1 U16.36(PA2)
PA3: R161.1 U16.37(PA3)
PA4: R163.1 U16.40(PA4)
PA5: R165.1 U16.41(PA5)
PA6: R167.1 U16.42(PA6)
PA7: R169.1 U16.43(PA7)
PA8: R171.1 U16.100(PA8)
PA9: R173.1 U16.101(PA9)
PA10: R175.1 U16.102(PA10)
PA11: R178.1 U16.103(PA11)
PA12: R179.1 U16.104(PA12)
PA13: R181.1 U16.105(PA13)
PA14: R183.1 U16.109(PA14)
PB0: R153.2 U16.46(PB0)
PB1: R155.2 U16.47(PB1)
PB2: R160.2 U16.48(PB2)
PB3: R162.2 U16.133(PB3)
PB4: R164.2 U16.134(PB4)
PB5: R166.2 U16.135(PB5)
PB6: R168.2 U16.136(PB6)
PB7: R170.2 U16.137(PB7)
PB8: R172.2 U16.139(PB8)
PB9: R174.2 U16.140(PB9)
PB10: R176.2 U16.69(PB10)
PB12: R180.2 U16.73(PB12)
PB13: R182.2 U16.74(PB13)
PB14: R184.2 U16.75(PB14)
PB15: R185.2 U16.76(PB15)
PC0: R186.1 U16.26(PC0)
PC1: R187.1 U16.27(PC1)
PC4: R188.1 U16.44(PC4)
PC5: R189.1 U16.45(PC5)
PC6: R190.1 U16.96(PC6)
PC7: R191.1 U16.97(PC7)
PC8: R192.1 U16.98(PC8)
PC9: R193.1 U16.99(PC9)
PC10: R195.1 U16.111(PC10)
PC11: R196.1 U16.112(PC11)
PC12: R198.1 U16.113(PC12)
PC14-OSC32_IN: C78.2 U16.8(PC14-OSC32_IN) X4.2
PC15-OSC32_OUT: C79.2 U16.9(PC15-OSC32_OUT) X4.1
PH0-OSC_IN: C76.2 U16.23(PH0-OSC_IN) X3.1(OSC1)
PH1-OSC_OUT: C77.2 U16.24(PH1-OSC_OUT) X3.3(OSC2)
RGB_LED: R202.2 ; port RGB_LED  [project net LED1_DIN]
SPI2_MISO: R184.1 ; port SPI2_MISO  [project net ETHCAT_MISO]
SPI2_MOSI: R185.1 ; port SPI2_MOSI  [project net ETHCAT_MOSI]
SPI2_NSS: R180.1 ; port SPI2_NSS  [project net ETHCAT_CS]
SPI2_SCK: R176.1 ; port SPI2_SCK  [project net ETHCAT_SCK]
SWCLK: D16.3(I/02) J14.4 R183.2
SWDIO: D16.4(I/03) J14.2 R181.2
SWO: D16.1(I/01) J14.6 R162.1
TEST_LED: R155.1 R199.1
UART4_RX: R196.2 ; port UART4_RX
UART4_TX: R195.2 ; port UART4_TX
UART5_TX: R198.2 ; port UART5_TX  [project net 485_DIN_3]
USART1_RX: R170.1 ; port USART1_RX  [project net ROUT_1]
USART1_TX: R168.1 ; port USART1_TX  [project net DIN_1]
USART6_RX: R191.2 ; port USART6_RX  [project net 485_ROUT_2]
USART6_TX: R190.2 ; port USART6_TX  [project net 485_DIN_2]
USB_FS_ID: R175.2 ; port USB_FS_ID
USB_FS_N: R178.2 ; port USB_FS_N
USB_FS_P: R179.2 ; port USB_FS_P
USB_FS_VBUS: R173.2 ; port USB_FS_VBUS
USB_SOF: R171.2 TP7.1
NetJ14_3: J14.3 R177.1
NetLED6_1: LED6.1 R199.2
NetQ5_3: Q5.3(D) R201.1 R202.1
NetR197_2: R197.2 U16.143(PDR_ON)

Not connected (* = marked no-connect by the designer): D16 5(I/04)*; J14 MP1* MP2* MP3* MP4* MP5* MP6* MP7*; U16 7(PC13)* 28(PC2_C)* 29(PC3_C)* 70(PB11)* 110(PA15)*

### Notes on the sheet
- (near SW9) RESET FUNCTION
- PRORAMMING TAG CONNECT
- (near X3) EXTERNAL HSE CLOCK
- (near X4) EXTERNAL LSE CLOCK
- RGB LED LEVEL TRANSLATOR
- File:
- Title:
- Date:
- Page
- Num:
- Total:
- Drawn By: Huzaifa Ali
- (in symbol STM32H503RBT6, part B) MCU CLK & RST

### Library data of the parts
C75 = CC0402JRX7R7BB104: as C30 on sheet Display-Sheet; Supplier: Digikey; Supplier Part Number: 311-1676-1-ND; Manufacturer Part Number: CC0402JRX7R7BB104; RoHS: Yes; Category: Ceramic Capacitors; Stock: 1659111; Pricing: 1=0.1, 10=0.046, 50=0.0262, 100=0.0203, 500=0.01528, 1000=0.012, 2500=0.01091, 5000=0.01004 (USD); Mounting Technology: Surface Mount; Case/Package: 0402; Case Code (Metric): 1005; Case Code (Imperial): 0402; Min Operating Temperature: -55°C; Max Operating Temperature: 125°C; Dielectric: X7R; Packaging: Tape and Reel; Package Quantity: 10000; Voltage Rating (DC): 16V; Voltage Rating: 16V; Series: CC; Construction: Flat; Length: 0.039inch; Width: 0.02inch; Height: 0.5mm; Thickness: 0.022inch; Lead Free: Lead Free; Halogen Free: Halogen Free; RoHS Compliant: Yes; ComponentLink1URL: https://datasheet.ciiva.com/13210/upy-gphc-x7r-6-3v-to-50v-8-12304-13210152.pdf?src-supplier=Mouser; ComponentLink1Description: https://datasheet.ciiva.com/13210/upy-gphc-x7r-6-3v-to-50v-8-12304-13210152.pdf?src-supplier=Mouser; LCSC Part Number: C541464
C76-C79 = CC0201JRNPO9BN150: CAP CER 15PF 50V C0G/NPO 0201; Manufacturer: Yageo; Item Type: Capacitor; Supplier: Future Electronics; Supplier Part Number: 2580314; Manufacturer Part Number: CC0201JRNPO9BN150; RoHS: Yes; Category: Ceramic Capacitors; Stock: 585000; Pricing: 15000=0.0012, 60000=0.0011, 225000=0.0011, 600000=0.001, 1500000=0.001 (USD); ComponentLink1URL: https://datasheet.ciiva.com/176/mlccorderingcode-176501.pdf?src-supplier=Digi-Key; ComponentLink1Description: https://datasheet.ciiva.com/176/mlccorderingcode-176501.pdf?src-supplier=Digi-Key; ComponentLink2URL: https://datasheet.ciiva.com/176/mlccorderingcode-176502.pdf?src-supplier=Digi-Key; ComponentLink2Description: https://datasheet.ciiva.com/176/mlccorderingcode-176502.pdf?src-supplier=Digi-Key; ComponentLink3URL: https://datasheet.ciiva.com/176/mlccorderingcode-176503.pdf?src-supplier=Digi-Key; ComponentLink3Description: https://datasheet.ciiva.com/176/mlccorderingcode-176503.pdf?src-supplier=Digi-Key; ComponentLink4URL: https://datasheet.ciiva.com/17205/upy-gp-np0-16v-to-50v-8-17205625.pdf?src-supplier=Future+Electronics; ComponentLink4Description: https://datasheet.ciiva.com/17205/upy-gp-np0-16v-to-50v-8-17205625.pdf?src-supplier=Future+Electronics; LCSC Part Number: C277480
D15 = ESDM2033MX4T5G: DIODE BIDIR ESD X4DFN2; Manufacturer: ON Semiconductor; Item Type: (TVS/ESD); Supplier: Avnet; LCSC Part Number: C896720; Manufacturer Part Number: ESDM2033MX4T5G; RoHS: Yes; Stock: 629400; Pricing: 8961=0.04129, 9000=0.04018, 18000=0.03906, 45000=0.03794, 90000=0.03683, 450000=0.03571, 900000=0.0346 (USD); Series: -
D16 = ESDALC6V1W5: TVS DIODE 3VWM SOT323-5; Manufacturer: STMicroelectronics; Item Type: TVS Diodes; Supplier: Future Electronics; LCSC Part Number: C703691; Manufacturer Part Number: ESDALC6V1W5; RoHS: Yes; Stock: 3000; Pricing: 3000=0.0569, 9000=0.0547, 12000=0.0774, 15000=0.0538, 30000=0.0749, 45000=0.0518, 75000=0.05 (USD); ComponentLink1URL: https://datasheet.ciiva.com/23847/cd00002946-23847220.pdf?src-supplier=Newark; ComponentLink1Description: https://datasheet.ciiva.com/23847/cd00002946-23847220.pdf?src-supplier=Newark; ComponentLink2URL: https://datasheet.ciiva.com/4509/cd00002946-81943-4509940.pdf?src-supplier=Mouser; ComponentLink2Description: https://datasheet.ciiva.com/4509/cd00002946-81943-4509940.pdf?src-supplier=Mouser; ComponentLink3URL: https://datasheet.ciiva.com/5782/cd00002946-5782886.pdf?src-supplier=Farnell; ComponentLink3Description: https://datasheet.ciiva.com/5782/cd00002946-5782886.pdf?src-supplier=Farnell; ComponentLink4URL: https://datasheet.ciiva.com/338/cd00002946-338376.pdf?src-supplier=Digikey; ComponentLink4Description: https://datasheet.ciiva.com/338/cd00002946-338376.pdf?src-supplier=Digikey; ComponentLink5URL: https://datasheet.ciiva.com/338/cd00002946-338377.pdf?src-supplier=Digikey; ComponentLink5Description: https://datasheet.ciiva.com/338/cd00002946-338377.pdf?src-supplier=Digikey; ComponentLink6URL: https://datasheet.ciiva.com/338/cd00002946-338378.pdf?src-supplier=Digikey; ComponentLink6Description: https://datasheet.ciiva.com/338/cd00002946-338378.pdf?src-supplier=Digikey
J14 = TC2030-IDC: CABLE ADAPTER 6 POS; Manufacturer: Tag-Connect; ComponentLink1URL: http://www.tag-connect.com/Materials/TC2030-MCP%20Datasheet.pdf?src-supplier=Digi-Key; ComponentLink1Description: http://www.tag-connect.com/Materials/TC2030-MCP%20Datasheet.pdf?src-supplier=Digi-Key; Supplier 1: Digi-Key; Manufacturer Part Number: TC2030-IDC; Stock 1: 284; Pricing 1: 1=43.71 (USD); Package Quantity: 1; Supplier Part Number 1: TC2030-IDC-ND
LED6 = NCD0603Y2: yellow 0603 Light Emitting Diodes (LED) ROHS; Manufacturer: Foshan NationStar Optoelectronics; Manufacturer Part Number: NCD0603Y2; Package: 0603; LCSC Part Number: C89811; Item Type: LED; ComponentLink1Description: LCSC; ComponentLink1URL: https://www.lcsc.com/product-detail/Light-Emitting-Diodes-LED_Foshan-NationStar-Optoelectronics-NCD0603Y2_C89811.html
Q5 = Si2302CDS: N-CHANNEL 20-V (D-S) MOSFET; Manufacturer: TECH PUBLIC; ComponentLink1Description: LCSC; ComponentLink1URL: https://www.lcsc.com/product-detail/MOSFETs_TECH-PUBLIC-SI2302CDS_C5310968.html; Manufacturer Part Number: SI2302CDS; Package: SOT-23; LCSC Part Number: C5310968; Item Type: Mosfet
R152-R155 R159-R193 R195 R196 R198 = RC0402FR-070RL: as R77-R83 on sheet Display-Sheet; Supplier 1: Mouser; Manufacturer Part Number: RC0402FR-070RL; RoHS: Yes; Stock 1: 8556842; Pricing 1: 1=0.10000, 10=0.01400, 50=0.01400, 100=0.00600, 1000=0.00300, 5000=0.00200, 10000=0.00100 (USD); Mount: Surface Mount; Case/Package: 0402; Contact Plating: Tin,Matte; Case Code (Imperial): 0402; Case Code (Metric): 1005; Size Code: 0402; Min Operating Temperature: -55°C; Max Operating Temperature: 155°C; Resistance: 0R; Resistor Type: Thick Film; Packaging: Tape and Reel; Termination: SMD/SMT; Features: Moisture Resistant; Series: RC; Number of Terminations: 2; Length: 1mm; Width: 0.5mm; Height: 0.35mm; Radiation Hardening: No; Lead Free: Lead Free; RoHS Compliant: Yes; ComponentLink1URL: https://datasheet.ciiva.com/8896/pyu-rc0402-51-rohs-l-6-8896149.pdf?src-supplier=Avnet; ComponentLink1Description: https://datasheet.ciiva.com/8896/pyu-rc0402-51-rohs-l-6-8896149.pdf?src-supplier=Avnet; ComponentLink2URL: https://datasheet.ciiva.com/16790/pyu-rc0402-51-rohs-l-6-r-16790444.pdf?src-supplier=Future+Electronics; ComponentLink2Description: https://datasheet.ciiva.com/16790/pyu-rc0402-51-rohs-l-6-r-16790444.pdf?src-supplier=Future+Electronics; Supplier Part Number 1: 603-RC0402FR-070RL; LCSC Part Number: C106231
R156-R158 R194 R197 R200 R201 = RC0402FR-0710KL: as R84 on sheet Display-Sheet; Supplier 1: Mouser; Manufacturer Part Number: RC0402FR-0710KL; RoHS: Yes; Category: Chip SMD Resistors; Stock 1: 18648329; Pricing 1: 1=0.10000, 10=0.01400, 50=0.01400, 100=0.00500, 1000=0.00300, 10000=0.00200 (USD); Case/Package: 0402; Number of Pins: 2; Case Code (Imperial): 0402; Case Code (Metric): 1005; Min Operating Temperature: -55°C; Max Operating Temperature: 155°C; Resistor Type: Thick Film; Tolerance: 1%; Packaging: Tape and Reel; Voltage Rating: 50V; Termination: SMD/SMT; Working Voltage: 50V; Number of Terminations: 2; Features: Moisture Resistant; Series: RC; Resistance Tolerance: 1%; Construction: Rectangular; Length: 1mm; Width: 0.5mm; Height: 0.32mm; Depth: 0.5mm; Lead Pitch: 0.2mm; REACH SVHC: No SVHC; Lead Free: Lead Free; RoHS Compliant: Yes; Military Standard: Not; ComponentLink1URL: https://datasheet.ciiva.com/7660/38568-7660787.pdf?src-supplier=Element14; ComponentLink1Description: https://datasheet.ciiva.com/7660/38568-7660787.pdf?src-supplier=Element14; ComponentLink2URL: https://datasheet.ciiva.com/7849/1686128-7849814.pdf?src-supplier=Element14; ComponentLink2Description: https://datasheet.ciiva.com/7849/1686128-7849814.pdf?src-supplier=Element14; ComponentLink3URL: https://datasheet.ciiva.com/7983/1018594-7983486.pdf?src-supplier=Element14; ComponentLink3Description: https://datasheet.ciiva.com/7983/1018594-7983486.pdf?src-supplier=Element14; ComponentLink4URL: https://datasheet.ciiva.com/22747/1018594-22747512.pdf?src-supplier=Element14; ComponentLink4Description: https://datasheet.ciiva.com/22747/1018594-22747512.pdf?src-supplier=Element14; ComponentLink5URL: https://datasheet.ciiva.com/12667/pyu-rc0402-51-rohs-l-6-r-12667067.pdf?src-supplier=Mouser; ComponentLink5Description: https://datasheet.ciiva.com/12667/pyu-rc0402-51-rohs-l-6-r-12667067.pdf?src-supplier=Mouser; ComponentLink6URL: https://datasheet.ciiva.com/7849/1784430-7849813.pdf?src-supplier=Element14; ComponentLink6Description: https://datasheet.ciiva.com/7849/1784430-7849813.pdf?src-supplier=Element14; ComponentLink7URL: https://datasheet.ciiva.com/7849/1784430-7849815.pdf?src-supplier=Element14; ComponentLink7Description: https://datasheet.ciiva.com/7849/1784430-7849815.pdf?src-supplier=Element14; Supplier Part Number 1: 603-RC0402FR-0710KL; LCSC Part Number: C60490
R199 = RC0402FR-07240RL: RES 240 OHM 1% 1/16W 0402; Manufacturer: Yageo; Item Type: Resistors; Power Rating: 63mW; Temperature Coefficient: 100ppm/°C; Voltage Rating (DC): 50V; Supplier 1: Mouser; Manufacturer Part Number: RC0402FR-07240RL; RoHS: Yes; Stock 1: 1903202; Pricing 1: 1=0.10000, 10=0.01200, 50=0.01200, 100=0.00500, 1000=0.00300, 10000=0.00100 (USD); Case/Package: 0402; Case Code (Metric): 1005; Case Code (Imperial): 0402; Size Code: 0402; Min Operating Temperature: -55°C; Max Operating Temperature: 155°C; Resistance: 240R; Tolerance: 1%; Packaging: Tape and Reel; Resistor Type: Thick Film; Voltage Rating: 50V; Package Quantity: 1; Number of Terminations: 2; Termination: SMD/SMT; Max Power Dissipation: 63mW; Features: Moisture Resistant; Series: RC; Construction: Rectangular; Resistance Tolerance: 1%; Length: 1mm; Width: 0.02inch; Height: 0.016inch; Depth: 0.5mm; REACH SVHC: Unknown; Lead Free: Lead Free; RoHS Compliant: Yes; Military Standard: Not; ComponentLink1URL: https://datasheet.ciiva.com/7849/1018594-7849915.pdf?src-supplier=Element14; ComponentLink1Description: https://datasheet.ciiva.com/7849/1018594-7849915.pdf?src-supplier=Element14; ComponentLink2URL: https://datasheet.ciiva.com/7849/1018594-7849916.pdf?src-supplier=Element14; ComponentLink2Description: https://datasheet.ciiva.com/7849/1018594-7849916.pdf?src-supplier=Element14; ComponentLink3URL: https://datasheet.ciiva.com/2519/pyu-r-int-thick-7-2519157.pdf?src-supplier=Digi-Key; ComponentLink3Description: https://datasheet.ciiva.com/2519/pyu-r-int-thick-7-2519157.pdf?src-supplier=Digi-Key; ComponentLink4URL: https://datasheet.ciiva.com/2519/pyu-r-int-thick-7-2519158.pdf?src-supplier=Digi-Key; ComponentLink4Description: https://datasheet.ciiva.com/2519/pyu-r-int-thick-7-2519158.pdf?src-supplier=Digi-Key; ComponentLink5URL: https://datasheet.ciiva.com/2519/pyu-r-int-thick-7-2519156.pdf?src-supplier=Digi-Key; ComponentLink5Description: https://datasheet.ciiva.com/2519/pyu-r-int-thick-7-2519156.pdf?src-supplier=Digi-Key; ComponentLink6URL: https://datasheet.ciiva.com/12669/pyu-rc0402-51-rohs-l-6-r-12669689.pdf?src-supplier=Mouser; ComponentLink6Description: https://datasheet.ciiva.com/12669/pyu-rc0402-51-rohs-l-6-r-12669689.pdf?src-supplier=Mouser; ComponentLink7URL: https://datasheet.ciiva.com/17419/pyu-rc0402-51-rohs-l-6-r-17419482.pdf?src-supplier=Future+Electronics; ComponentLink7Description: https://datasheet.ciiva.com/17419/pyu-rc0402-51-rohs-l-6-r-17419482.pdf?src-supplier=Future+Electronics; Supplier Part Number 1: 603-RC0402FR-07240RL; LCSC Part Number: C114755
R202 = RC0402JR-0775RL: RES 75 OHM 5% 1/16W 0402; Manufacturer: Yageo; Item Type: Resistor; Temperature Coefficient: 100ppm/°C; Power Rating: 62.5mW; Voltage Rating: 50V; Max Power Dissipation: 63mW; Supplier: Digikey; Supplier Part Number: 311-75JRCT-ND; Manufacturer Part Number: RC0402JR-0775RL; RoHS: Yes; Stock: 2993323; Pricing: 1=0.1, 10=0.018, 50=0.0102, 100=0.0083, 500=0.00528, 1000=0.00444, 5000=0.00307 (USD); Case/Package: 0402; Pins: 2; Contact Plating: Tin,Lead; Case Code (Imperial): 0402; Case Code (Metric): 1005; Min Operating Temperature: -55°C; Max Operating Temperature: 155°C; Value: 75R; Tolerance: 5%; Resistor Type: Thick Film; Packaging: Tape and Reel; Termination: SMD/SMT; Voltage Rating (DC): 50V; Features: Moisture Resistant; Series: RC; Number of Terminations: 2; Resistance Tolerance: 5%; Length: 1mm; Width: 0.5mm; Height: 0.35mm; Reach SVHC Compliant: No; Lead Free: Lead Free; RoHS Compliant: Yes; ComponentLink1URL: https://datasheet.ciiva.com/7983/1018594-7983612.pdf?src-supplier=Element14; ComponentLink1Description: https://datasheet.ciiva.com/7983/1018594-7983612.pdf?src-supplier=Element14; ComponentLink2URL: https://datasheet.ciiva.com/17082/pyu-rc0402-51-rohs-l-6-r-17082239.pdf?src-supplier=Future+Electronics; ComponentLink2Description: https://datasheet.ciiva.com/17082/pyu-rc0402-51-rohs-l-6-r-17082239.pdf?src-supplier=Future+Electronics; LCSC Part Number: C137841
SW9 SW11 = B3U-1000P: SWITCH TACTILE SPST-NO 0.05A 12V; Manufacturer: Omron; Mechanical Life: 200000Cycles; Operating Force: 1.5N; Throw Configuration: SPST; Current Rating: 50mA; Contact Resistance: 100mR; Illumination Type: Non-Illuminated,Illuminated; Switch Travel: 0.15mm; Switch Function: Off-Mom; Actuator Type: Standard; Actuator Length: 0.4mm; Ratings: Dust Proof,IP40; ComponentLink1URL: http://www.farnell.com/datasheets/60838.pdf?src-supplier=Farnell; ComponentLink1Description: http://www.farnell.com/datasheets/60838.pdf?src-supplier=Farnell; ComponentLink2URL: http://www.farnell.com/datasheets/60838.pdf?src-supplier=Element14; ComponentLink2Description: http://www.farnell.com/datasheets/60838.pdf?src-supplier=Element14; ComponentLink3URL: https://omronfs.omron.com/en_US/ecb/products/pdf/en-b3u.pdf?src-supplier=Digi-Key; ComponentLink3Description: https://omronfs.omron.com/en_US/ecb/products/pdf/en-b3u.pdf?src-supplier=Digi-Key; ComponentLink4URL: http://www.omron.com/ecb/products/pdf/en-b3u.pdf?src-supplier=Digi-Key; ComponentLink4Description: http://www.omron.com/ecb/products/pdf/en-b3u.pdf?src-supplier=Digi-Key; ComponentLink5URL: https://www.distrelec.biz/Web/Downloads/he/et/B3U_eng_datasheet.pdf?mime=application%2Fpdf&src-supplier=Distrelec; ComponentLink5Description: https://www.distrelec.biz/Web/Downloads/he/et/B3U_eng_datasheet.pdf?mime=application%2Fpdf&src-supplier=Distrelec; ComponentLink6URL: http://www.onlinecomponents.com/productFiles/mf-OM/en-b3u.pdf?src-supplier=Onlinecomponents.com; ComponentLink6Description: http://www.onlinecomponents.com/productFiles/mf-OM/en-b3u.pdf?src-supplier=Onlinecomponents.com; Supplier 1: Digi-Key; Manufacturer Part Number: B3U-1000P; Stock 1: 116454; Pricing 1: 1=1, 10=0.961, 25=0.9064, 50=0.7976, 100=0.7251, 250=0.68888, 500=0.67074, 1000=0.52571 (USD); Mount: Surface Mount; Weight: 0.000776oz; Contact Material: Silver; Min Operating Temperature: -25°C; Max Operating Temperature: 70°C; Packaging: Tape and Reel; Voltage Rating (DC): 12V; Package Quantity: 1; Max Current Rating: 50mA; Termination: SMD/SMT; Orientation: Straight; Max Voltage Rating (DC): 12V; Electrical Life: 200000Cycles; Insulation Resistance: 100MR; Contact Current Rating: 50mA; Length: 4mm; Height: 1.2mm; Depth: 2.5mm; Width: 3mm; REACH SVHC: Unknown; Lead Free: Lead Free; ComponentLink7URL: https://www.verical.com/server-webapp/html/getDatasheet?partID=552554&src-supplier=Verical; ComponentLink7Description: https://www.verical.com/server-webapp/html/getDatasheet?partID=552554&src-supplier=Verical; ComponentLink8URL: http://www.farnell.com/datasheets/1685550.pdf?src-supplier=Element14; ComponentLink8Description: http://www.farnell.com/datasheets/1685550.pdf?src-supplier=Element14; ComponentLink9URL: http://www.farnell.com/datasheets/2610940.pdf?src-supplier=Farnell; ComponentLink9Description: http://www.farnell.com/datasheets/2610940.pdf?src-supplier=Farnell; ComponentLink10URL: https://www.alliedelec.com/m/d/4c8a9ef82804fc3c241a13c1e298fd73.pdf?src-supplier=Allied+Electronics; ComponentLink10Description: https://www.alliedelec.com/m/d/4c8a9ef82804fc3c241a13c1e298fd73.pdf?src-supplier=Allied+Electronics; Supplier Part Number 1: SW1020DKR-ND; LCSC Part Number: C231329; Item Type: Switch
SW10 = DSIC03LSGET: 3 positions SPST Black Flat Toggle, Raised Style SMD-6P,6x7.6mm DIP Switches ROHS; Manufacturer: DongGuan KINGTEK Industrial Co.,LTD; Manufacturer Part Number: DSIC03LSGET; Package: SMD-6P,6x7.6mm; LCSC Part Number: C57453; Item Type: DIP Switches; ComponentLink1Description: LCSC; ComponentLink1URL: https://www.lcsc.com/product-detail/DIP-Switches_DongGuan-KINGTEK-Industrial-Co-LTD-DSIC03LSGET_C57453.html
TP7 = TEST POINT 0.5mm Dia: Test Point ON; Item Type: Test Point; Manufacturer Part Number: TEST POINT 0.5mm Dia
U16 = STM32H723ZGT6: IC MCU 32BIT 1MB FLASH 144LQFP; Manufacturer: STMicroelectronics; Interface: 39,40,224,1514,1515,1518,1532,1533Interface; Memory Format: 4498,11064MemoryType; Data Bus Width: 32b; Frequency: 550MHz; Max Supply Voltage: 3.6V; Min Supply Voltage: 1.62V; Nominal Supply Current: 4uA; Number of A/D Converters: 1NUMBER; Number of ADC Channels: 16NUMBER; Number of I2C Channels: 5NUMBER; Number of I/Os: 112NUMBER; Number of SPI Channels: 6NUMBER; Number of Timers/Counters: 4NUMBER; RAM Size: 564KB; Supplier: Future Electronics; LCSC Part Number: C730146; Manufacturer Part Number: STM32H723ZGT6; RoHS: No; Item Type: IC; Stock: 4380; Pricing: 60=7.31, 120=7.27, 180=7.25, 240=7.23, 300=7.18 (USD); Min Operating Temperature: -40°C; Max Operating Temperature: 85°C; Density: 1MB; Memory Size: 1MB; Number of Ethernet Channels: 1NUMBER; Number of UART Channels: 6NUMBER; Number of USB Channels: 1NUMBER; Height: 1.6mm
X3 = Q22FA12800090: CRYSTAL 25.0000MHZ 12PF SMD; Manufacturer: Seiko Epson; ComponentLink1Description: LCSC; ComponentLink1URL: https://www.lcsc.com/product-detail/Crystals_Seiko-Epson-Q22FA12800090_C255883.html; Manufacturer Part Number: Q22FA12800090; Package: SMD2016-4P; LCSC Part Number: C255883; Item Type: Crystal
X4 = NX3215SA-32.768K-STD-MUA-8: CRYSTAL 32.7680KHZ 12.5PF SMD; Manufacturer: NDK; Frequency: 32.768kHz; Frequency Tolerance: 20ppm; ESR (Equivalent Series Resistance): 70kR; Supplier 1: Digi-Key; Manufacturer Part Number: NX3215SA-32.768K-STD-MUA-8; Stock 1: 29951; Pricing 1: 1=0.68, 10=0.602, 50=0.5628, 100=0.4974, 500=0.47124, 1000=0.3927 (USD); Mount: Surface Mount; Case/Package: SMD/SMT; Number of Pins: 2; Min Operating Temperature: -40°C; Max Operating Temperature: 85°C; Package Quantity: 1000; Load Capacitance: 12.5pF; Packaging: Tape and Reel; Length: 0.126inch; Height: 0.035inch; Width: 0.059inch; Lead Free: Lead Free; ComponentLink1URL: https://media.digikey.com/pdf/Data%20Sheets/NDK%20PDFs/NX3215SA-32.768K-STD-MUA-8.pdf?src-supplier=Digi-Key; ComponentLink1Description: https://media.digikey.com/pdf/Data%20Sheets/NDK%20PDFs/NX3215SA-32.768K-STD-MUA-8.pdf?src-supplier=Digi-Key; ComponentLink2URL: http://www.ndk.com/images/products/catalog/c_NX3215SA-STD-MUA-14_e.pdf?src-supplier=Digi-Key; ComponentLink2Description: http://www.ndk.com/images/products/catalog/c_NX3215SA-STD-MUA-14_e.pdf?src-supplier=Digi-Key; Supplier Part Number 1: 644-1156-6-ND; LCSC Part Number: C156245